# EAGLE schematic BMSTEST-v1.0 (EAGLE 7.7.0)

## Sheet 1 of 4
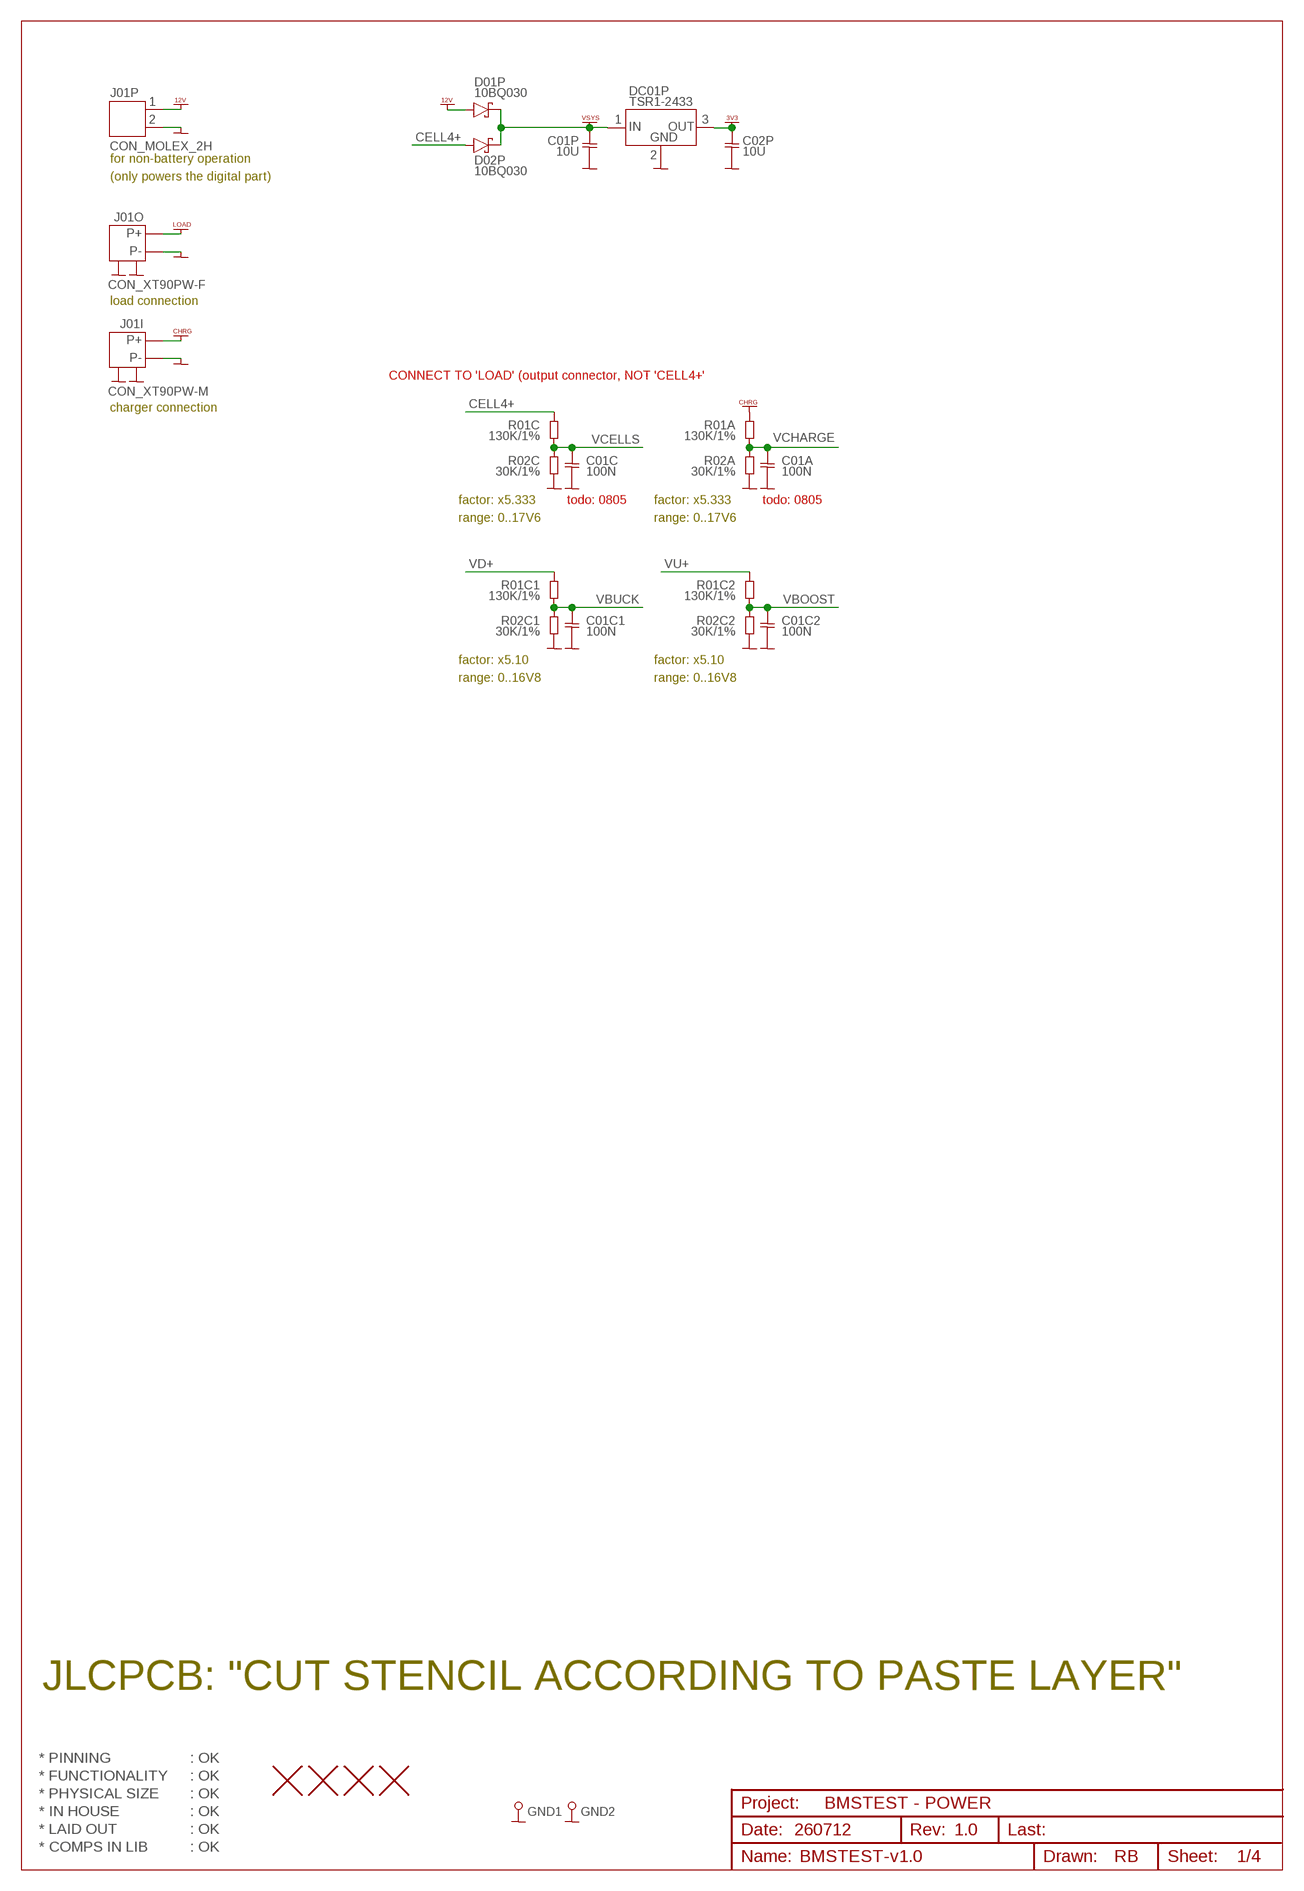
[diagram p0: schematic, sheet 1]

### Parts
C01A  100N  CAP0603  [CAP0603]
C01C  100N  CAP0603  [CAP0603]
C01C1  100N  CAP0603  [CAP0603]
C01C2  100N  CAP0603  [CAP0603]
C01P  10U  CAP0805  [CAP0805]
C02P  10U  CAP0805  [CAP0805]
D01P  10BQ030  DIODE_10BQ030  [DIODE_SMB]
D02P  10BQ030  DIODE_10BQ030  [DIODE_SMB]
DC01P  TSR1-2433  [TSR1-2433]
GND1  PIN_TEST  [HOLE_PTH_0.8MM]
GND2  PIN_TEST  [HOLE_PTH_0.8MM]
H1  HOLE_NPTH_3.2MM  [HOLE_NPTH_3.2MM]
H2  HOLE_NPTH_3.2MM  [HOLE_NPTH_3.2MM]
H3  HOLE_NPTH_3.2MM  [HOLE_NPTH_3.2MM]
H4  HOLE_NPTH_3.2MM  [HOLE_NPTH_3.2MM]
J01I  CON_XT90PW-M  [CON_XT90PW-M]
J01O  CON_XT90PW-F  [CON_XT90PW-F]
J01P  CON_MOLEX_2H  [CON_MOLEX_2H]
R01A  130K/1%  RES0603  [RES0603]
R01C  130K/1%  RES0603  [RES0603]
R01C1  130K/1%  RES0603  [RES0603]
R01C2  130K/1%  RES0603  [RES0603]
R02A  30K/1%  RES0603  [RES0603]
R02C  30K/1%  RES0603  [RES0603]
R02C1  30K/1%  RES0603  [RES0603]
R02C2  30K/1%  RES0603  [RES0603]

### Nets
CELL4+ [dikke power]: D02P.A(+) R01C.2 ; also sheet 4
GND: C01A.2 C01C1.2 C01C2.2 C01C.2 C01P.2 C02P.2 DC01P.2(2.GND) GND1.1 GND2.1 J01I.- J01I.CASE1 J01I.CASE2 J01O.- J01O.CASE1 J01O.CASE2 J01P.2 R02A.1 R02C1.1 R02C2.1 R02C.1 ; also sheet 2,3,4
V_CHARGER: J01I.+ R01A.2 ; also sheet 4
V_LOAD: J01O.+ ; also sheet 4
VBOOST: C01C2.1 R01C2.1 R02C2.2 ; also sheet 2
VBUCK: C01C1.1 R01C1.1 R02C1.2 ; also sheet 2
VCELLS: C01C.1 R01C.1 R02C.2 ; also sheet 2
VCHARGE: C01A.1 R01A.1 R02A.2 ; also sheet 2
VD+: R01C1.2 ; also sheet 3
VDD_3V3: C02P.1 DC01P.3(3.OUT) ; supply symbol labelled VCC_3V3 ; also sheet 2,3,4
VDD_12V: D01P.A(+) J01P.1 ; supply symbol labelled VCC_12V
VSYS: C01P.1 D01P.C(-) D02P.C(-) DC01P.1(1.IN) ; also sheet 3
VU+: R01C2.2 ; also sheet 3

### Notes on the sheet
- for non-battery operation
- (only powers the digital part)
- load connection
- CONNECT TO 'LOAD' (output connector, NOT 'CELL4+'
- charger connection
- factor: x5.333 | todo: 0805 | factor: x5.333 | todo: 0805
- range: 0..17V6 | range: 0..17V6
- factor: x5.10 | factor: x5.10
- range: 0..16V8 | range: 0..16V8
- JLCPCB: "CUT STENCIL ACCORDING TO PASTE LAYER"
- * PINNING | : OK
- * FUNCTIONALITY | : OK
- * PHYSICAL SIZE | : OK
- BMSTEST - POWER
- * IN HOUSE | : OK
- * LAID OUT | : OK | 260712 | 1.0
- * COMPS IN LIB | : OK

## Sheet 2 of 4
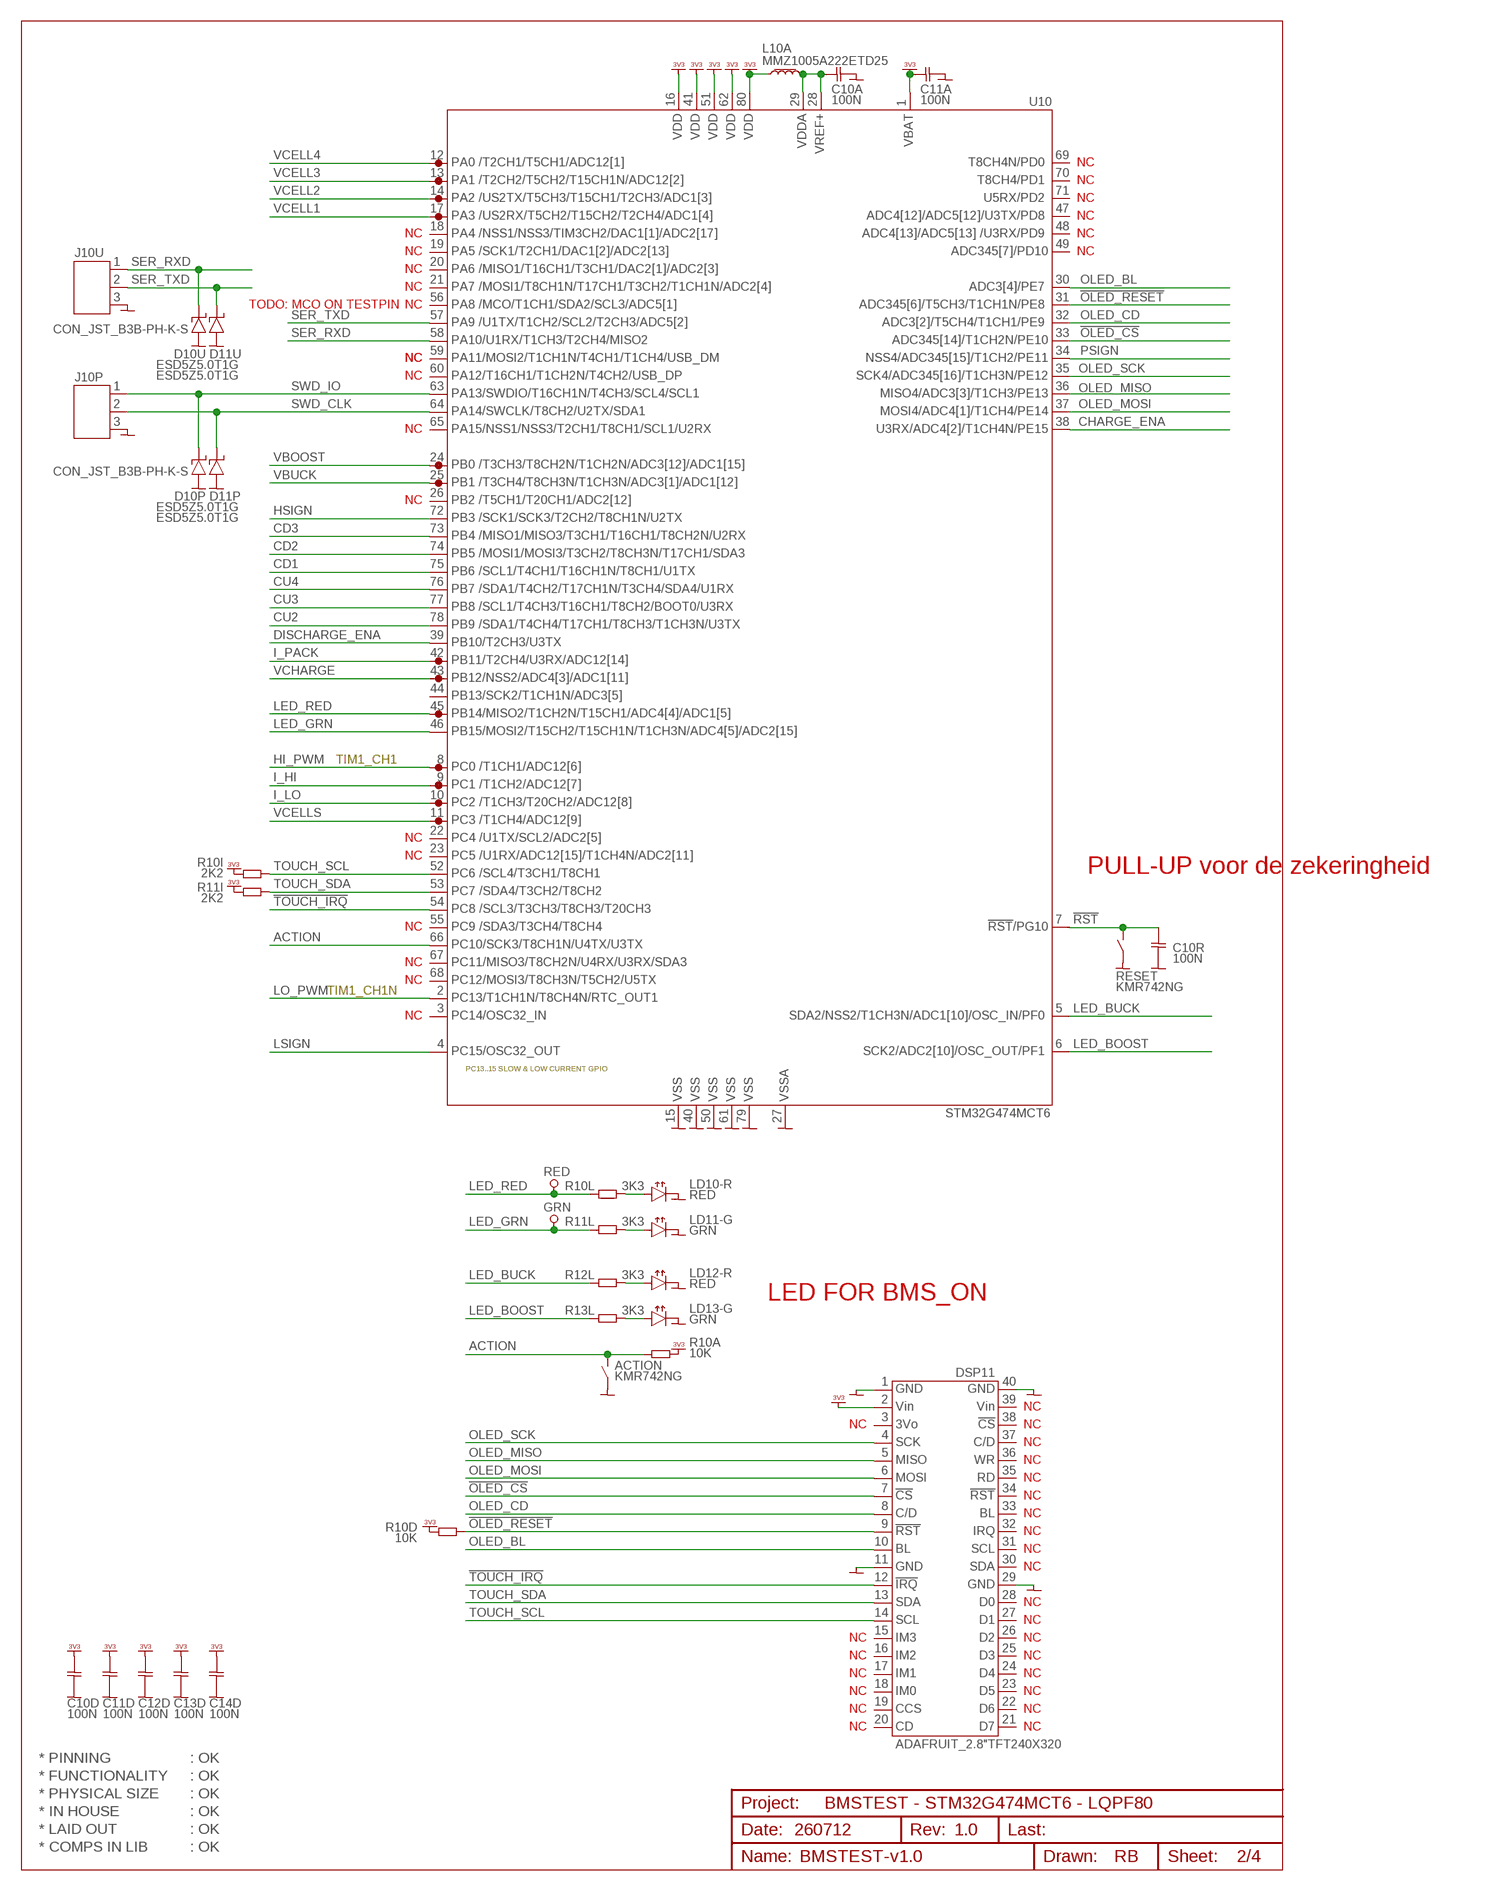
[diagram p1: schematic, sheet 2]

### Parts
ACTION  KMR742NG  SWITCH_PUSHBUTTON_KMR742NG  [SWITCH_PUSHBUTTON_KMR742NG]
C10A  100N  CAP0402  [CAP0402]
C10D  100N  CAP0402  [CAP0402]
C10R  100N  CAP0603  [CAP0603]
C11A  100N  CAP0402  [CAP0402]
C11D  100N  CAP0402  [CAP0402]
C12D  100N  CAP0402  [CAP0402]
C13D  100N  CAP0402  [CAP0402]
C14D  100N  CAP0402  [CAP0402]
D10P  ESD5Z5.0T1G  DIODE_TVS_SOD523  [DIODE_SOD523]
D10U  ESD5Z5.0T1G  DIODE_TVS_SOD523  [DIODE_SOD523]
D11P  ESD5Z5.0T1G  DIODE_TVS_SOD523  [DIODE_SOD523]
D11U  ESD5Z5.0T1G  DIODE_TVS_SOD523  [DIODE_SOD523]
DSP11  ADAFRUIT_2.8"TFT240X320  [ADAFRUIT_2.8"TFT240X320]
GRN  PIN_TEST  [HOLE_PTH_0.8MM]
J10P  CON_JST_B3B-PH-K-S  [CON_JST_B3B-PH-K-S]
J10U  CON_JST_B3B-PH-K-S  [CON_JST_B3B-PH-K-S]
L10A  MMZ1005A222ETD25  L_0402_LOSSY  [L_0402]
LD10-R  RED  LED_SMD_0603  [LED_SMD_0603]
LD11-G  GRN  LED_SMD_0603  [LED_SMD_0603]
LD12-R  RED  LED_SMD_0603  [LED_SMD_0603]
LD13-G  GRN  LED_SMD_0603  [LED_SMD_0603]
R10A  10K  RES0603  [RES0603]
R10D  10K  RES0603  [RES0603]
R10I  2K2  RES0402  [RES0402]
R10L  3K3  RES0603  [RES0603]
R11I  2K2  RES0402  [RES0402]
R11L  3K3  RES0603  [RES0603]
R12L  3K3  RES0603  [RES0603]
R13L  3K3  RES0603  [RES0603]
RED  PIN_TEST  [HOLE_PTH_0.8MM]
RESET  KMR742NG  SWITCH_PUSHBUTTON_KMR742NG  [SWITCH_PUSHBUTTON_KMR742NG]
U10  STM32G474MCT6  [LQFP80]

### Nets
!OLED_CS: DSP11.7(7.CS) U10.33(33.PE10)
!OLED_RESET: DSP11.9(9.!RST) R10D.2 U10.31(31.PE8)
!RST: C10R.1 RESET.1 RESET.4 U10.7(7.!RST)
!TOUCH_IRQ: DSP11.12(12.IRQ) U10.54(54.PC8)
ACTION: ACTION.1 ACTION.4 R10A.1 U10.66(66.PC10)
CD1: U10.75(75.PB6) ; also sheet 3
CD2: U10.74(74.PB5) ; also sheet 3
CD3: U10.73(73.PB4) ; also sheet 3
CHARGE_ENA: U10.38(38.PE15) ; also sheet 4
CU2: U10.78(78.PB9) ; also sheet 3
CU3: U10.77(77.PB8) ; also sheet 3
CU4: U10.76(76.PB7) ; also sheet 3
DISCHARGE_ENA: U10.39(39.PB10) ; also sheet 4
GND: ACTION.2 ACTION.3 C10A.2 C10D.2 C10R.2 C11A.2 C11D.2 C12D.2 C13D.2 C14D.2 D10P.A D10U.A D11P.A D11U.A DSP11.1(1.GND) DSP11.11(11.GND) DSP11.29(29.GND) DSP11.40(40.GND) J10P.3 J10U.3 LD10-R.C LD11-G.C LD12-R.C LD13-G.C RESET.2 RESET.3 U10.15(15.VSS) U10.27(27.VSSA) U10.40(40.VSS) U10.50(50.VSS) U10.61(61.VSS) U10.79(79.VSS) ; also sheet 1,3,4
HI_PWM: U10.8(8.PC0) ; also sheet 3
HSIGN: U10.72(72.PB3) ; also sheet 3
I_HI: U10.9(9.PC1) ; also sheet 3
I_LO: U10.10(10.PC2) ; also sheet 3
I_PACK: U10.42(42.PB11) ; also sheet 4
LED_BOOST: R13L.1 U10.6(6.OSC_OUT)
LED_BUCK: R12L.1 U10.5(5.OSC_IN)
LED_GRN: GRN.1 R11L.1 U10.46(46.PB15)
LED_RED: R10L.1 RED.1 U10.45(45.PB14)
LO_PWM: U10.2(2.PC13) ; also sheet 3
LSIGN: U10.4(4.PC15) ; also sheet 3
N$23: LD11-G.A R11L.2
N$35: LD12-R.A R12L.2
N$36: LD13-G.A R13L.2
N$39: LD10-R.A R10L.2
OLED_BL: DSP11.10(10.BL) U10.30(30.PE7)
OLED_CD: DSP11.8(8.D/C) U10.32(32.PE9)
OLED_MISO: DSP11.5(5.MISO) U10.36(36.PE13)
OLED_MOSI: DSP11.6(6.MOSI) U10.37(37.PE14)
OLED_SCK: DSP11.4(4.SCK) U10.35(35.PE12)
PSIGN: U10.34(34.PE11) ; also sheet 4
SER_RXD: D10U.C J10U.1 U10.58(58.PA10)
SER_TXD: D11U.C J10U.2 U10.57(57.PA9)
SWD_CLK: D11P.C J10P.2 U10.64(64.PA14)
SWD_IO: D10P.C J10P.1 U10.63(63.PA13)
TOUCH_SCL: DSP11.14(14.SCL) R10I.1 U10.52(52.PC6)
TOUCH_SDA: DSP11.13(13.SDA) R11I.1 U10.53(53.PC7)
VBOOST: U10.24(24.PB0) ; also sheet 1
VBUCK: U10.25(25.PB1) ; also sheet 1
VCELL1: U10.17(17.PA3) ; also sheet 4
VCELL2: U10.14(14.PA2) ; also sheet 4
VCELL3: U10.13(13.PA1) ; also sheet 4
VCELL4: U10.12(12.PA0) ; also sheet 4
VCELLS: U10.11(11.PC3) ; also sheet 1
VCHARGE: U10.43(43.PB12) ; also sheet 1
VDD_3V3: C10D.1 C11A.1 C11D.1 C12D.1 C13D.1 C14D.1 DSP11.2(2.VIN) L10A.1 R10A.2 R10D.1 R10I.2 R11I.2 U10.1(1.VBAT) U10.16(16.VDD) U10.41(41.VDD) U10.51(51.VDD) U10.62(62.VDD) U10.80(80.VDD) ; supply symbol labelled VCC_3V3 ; also sheet 1,3,4
VDDA1: C10A.1 L10A.2 U10.28(28.VREF+) U10.29(29.VDDA)
Unconnected: DSP11.3(3.3VO) DSP11.15(15.IM3) DSP11.16(16.IM2) DSP11.17(17.IM1) DSP11.18(18.IM0) DSP11.19(19.CCS) DSP11.20(20.CD) DSP11.21(21.D7) DSP11.22(22.D6) DSP11.23(23.D5) DSP11.24(24.D4) DSP11.25(25.D3) DSP11.26(26.D2) DSP11.27(27.D1) DSP11.28(28.D0) DSP11.30(30.SDA) DSP11.31(31.SCL) DSP11.32(32.IRQ) DSP11.33(33.BL) DSP11.34(34.!RST) DSP11.35(35.RD) DSP11.36(36.WR) DSP11.37(37.C/D) DSP11.38(38.CS) DSP11.39(39.VIN) U10.3(3.PC14) U10.18(18.PA4) U10.19(19.PA5) U10.20(20.PA6) U10.21(21.PA7) U10.22(22.PC4) U10.23(23.PC5) U10.26(26.PB2) U10.44(44.PB13) U10.47(47.PD8) U10.48(48.PD9) U10.49(49.PD10) U10.55(55.PC9) U10.56(56.PA8) U10.59(59.PA11) U10.60(60.PA12) U10.65(65.PA15) U10.67(67.PC11) U10.68(68.PC12) U10.69(69.PD0) U10.70(70.PD1) U10.71(71.PD2)

### Notes on the sheet
- NC
- NC
- NC
- NC
- NC | NC
- NC | NC
- NC
- NC
- TODO: MCO ON TESTPIN | NC
- NC | NC
- NC
- NC
- NC
- TIM1_CH1
- NC
- NC
- PULL-UP voor de zekeringheid
- NC
- NC
- NC
- TIM1_CH1N
- NC
- LED FOR BMS_ON
- NC
- NC | NC
- NC
- NC
- NC
- NC
- NC
- NC
- NC
- NC
- NC
- NC
- NC | NC
- NC | NC
- NC | NC
- NC | NC
- NC | NC
- NC | NC
- * PINNING | : OK
- * FUNCTIONALITY | : OK
- * PHYSICAL SIZE | : OK
- BMSTEST - STM32G474MCT6 - LQPF80
- * IN HOUSE | : OK
- * LAID OUT | : OK | 260712 | 1.0
- * COMPS IN LIB | : OK

## Sheet 3 of 4
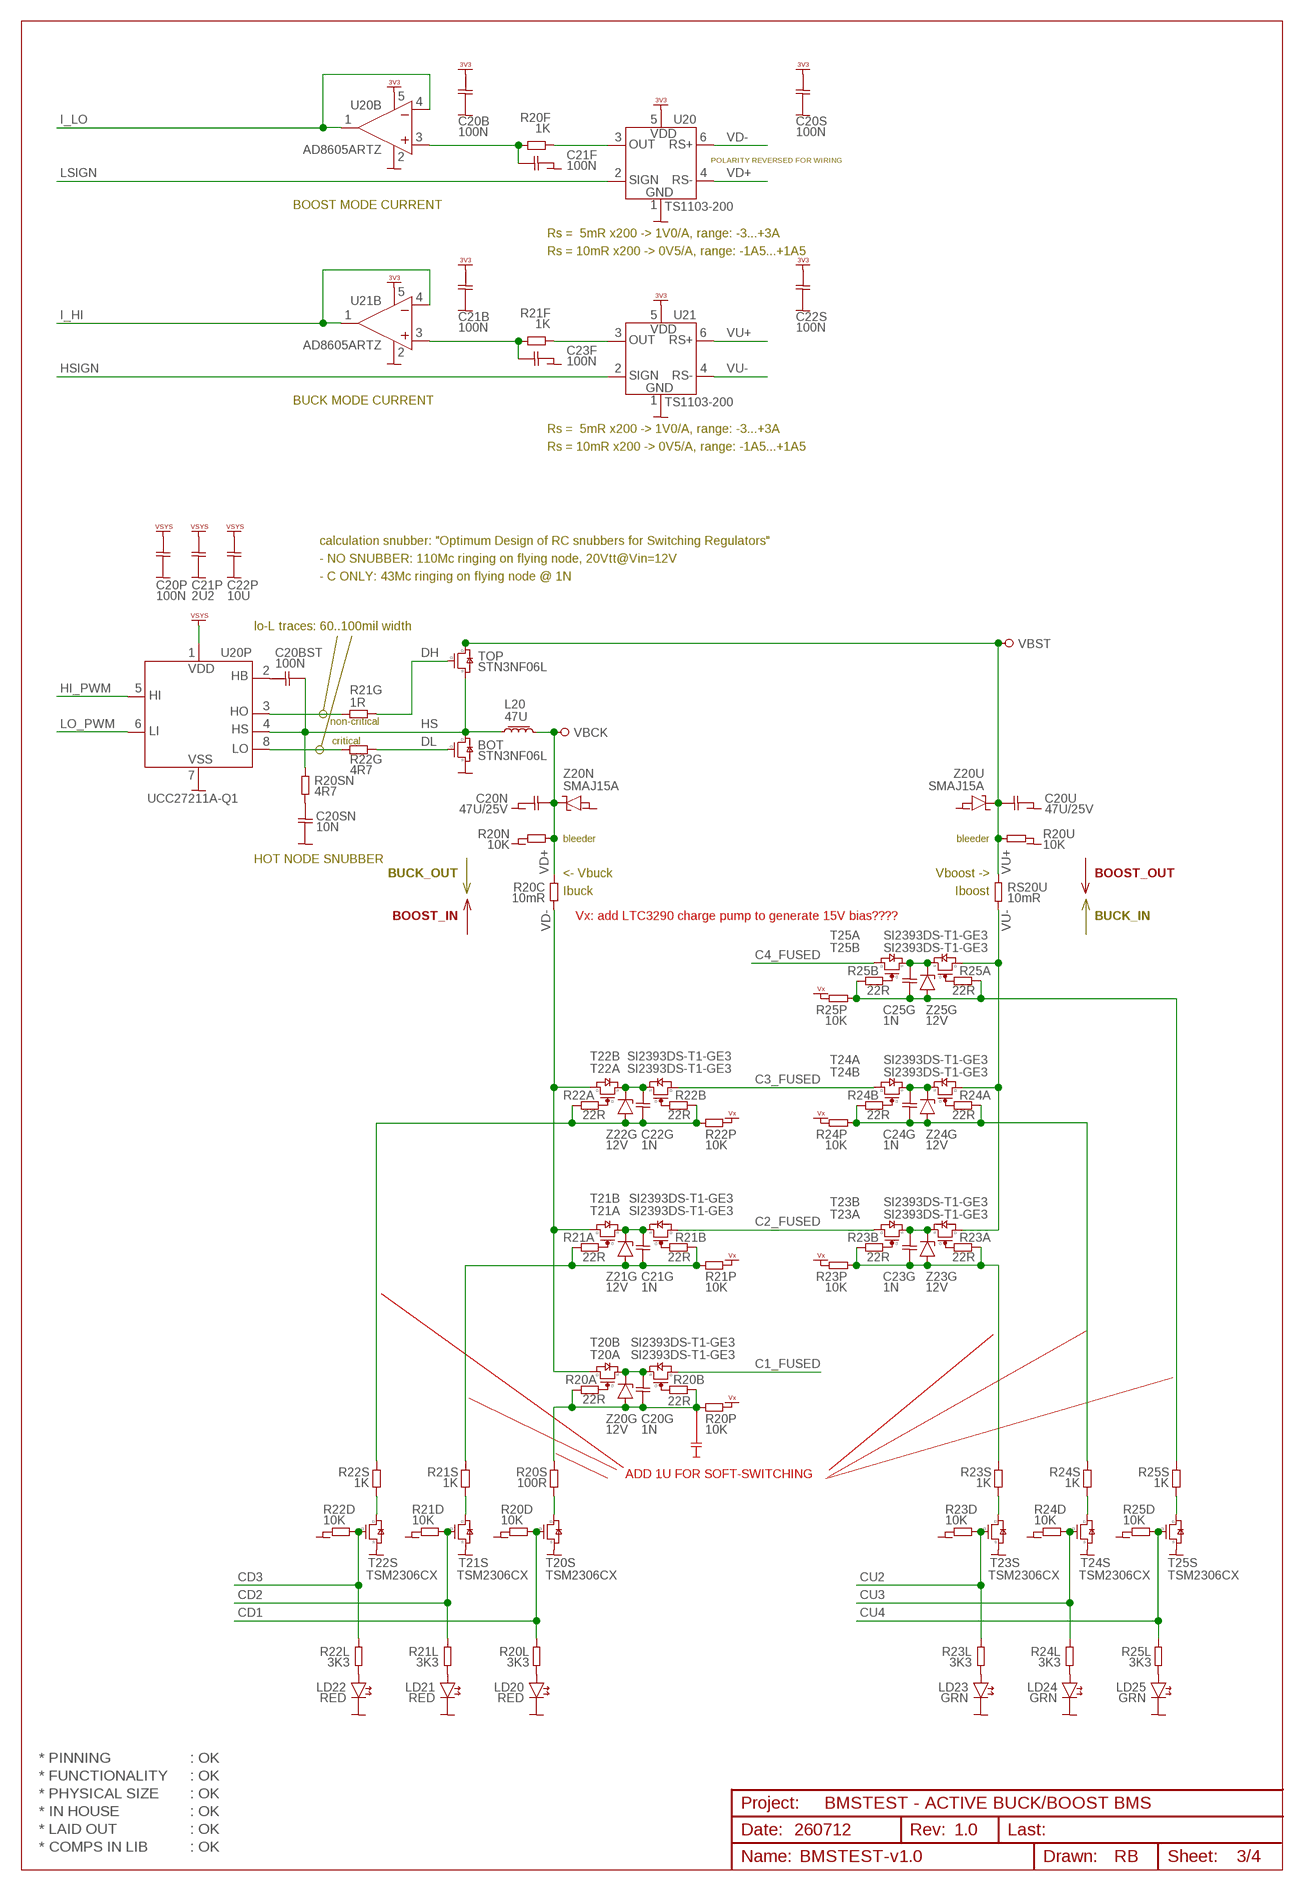
[diagram p2: schematic, sheet 3]

### Parts
BOT  STN3NF06L  NFET_SOT223_IRFL024ZPBF  [SOT223]
C20B  100N  CAP0603  [CAP0603]
C20BST  100N  CAP0805  [CAP0805]
C20G  1N  CAP0603  [CAP0603]
C20N  47U/25V  CAP1210  [CAP1210]
C20P  100N  CAP0603  [CAP0603]
C20S  100N  CAP0603  [CAP0603]
C20SN  10N  CAP0805  [CAP0805]
C20U  47U/25V  CAP1210  [CAP1210]
C21B  100N  CAP0603  [CAP0603]
C21F  100N  CAP0603  [CAP0603]
C21G  1N  CAP0603  [CAP0603]
C21P  2U2  CAP0603  [CAP0603]
C22G  1N  CAP0603  [CAP0603]
C22P  10U  CAP0805  [CAP0805]
C22S  100N  CAP0603  [CAP0603]
C23F  100N  CAP0603  [CAP0603]
C23G  1N  CAP0603  [CAP0603]
C24G  1N  CAP0603  [CAP0603]
C25G  1N  CAP0603  [CAP0603]
L20  47U  L_WE_HCI_6.9X6.9  [L_WE_HCI_6.9X6.9]
LD20  RED  LED_SMD_0603  [LED_SMD_0603]
LD21  RED  LED_SMD_0603  [LED_SMD_0603]
LD22  RED  LED_SMD_0603  [LED_SMD_0603]
LD23  GRN  LED_SMD_0603  [LED_SMD_0603]
LD24  GRN  LED_SMD_0603  [LED_SMD_0603]
LD25  GRN  LED_SMD_0603  [LED_SMD_0603]
R20A  22R  RES0603  [RES0603]
R20B  22R  RES0603  [RES0603]
R20C  10mR  RES1206  [RES1206]
R20D  10K  RES0603  [RES0603]
R20F  1K  RES0603  [RES0603]
R20L  3K3  RES0603  [RES0603]
R20N  10K  RES0805  [RES0805]
R20P  10K  RES0603  [RES0603]
R20S  100R  RES0603  [RES0603]
R20SN  4R7  RES0805  [RES0805]
R20U  10K  RES0805  [RES0805]
R21A  22R  RES0603  [RES0603]
R21B  22R  RES0603  [RES0603]
R21D  10K  RES0603  [RES0603]
R21F  1K  RES0603  [RES0603]
R21G  1R  RES0508  [RES0508]
R21L  3K3  RES0603  [RES0603]
R21P  10K  RES0603  [RES0603]
R21S  1K  RES0603  [RES0603]
R22A  22R  RES0603  [RES0603]
R22B  22R  RES0603  [RES0603]
R22D  10K  RES0603  [RES0603]
R22G  4R7  RES0508  [RES0508]
R22L  3K3  RES0603  [RES0603]
R22P  10K  RES0603  [RES0603]
R22S  1K  RES0603  [RES0603]
R23A  22R  RES0603  [RES0603]
R23B  22R  RES0603  [RES0603]
R23D  10K  RES0603  [RES0603]
R23L  3K3  RES0603  [RES0603]
R23P  10K  RES0603  [RES0603]
R23S  1K  RES0603  [RES0603]
R24A  22R  RES0603  [RES0603]
R24B  22R  RES0603  [RES0603]
R24D  10K  RES0603  [RES0603]
R24L  3K3  RES0603  [RES0603]
R24P  10K  RES0603  [RES0603]
R24S  1K  RES0603  [RES0603]
R25A  22R  RES0603  [RES0603]
R25B  22R  RES0603  [RES0603]
R25D  10K  RES0603  [RES0603]
R25L  3K3  RES0603  [RES0603]
R25P  10K  RES0603  [RES0603]
R25S  1K  RES0603  [RES0603]
RS20U  10mR  RES1206  [RES1206]
T20A  SI2393DS-T1-GE3  PFET_SOT23  [PFET_SOT23]
T20B  SI2393DS-T1-GE3  PFET_SOT23  [PFET_SOT23]
T20S  TSM2306CX  NFET_SOT23  [NFET_SOT23]
T21A  SI2393DS-T1-GE3  PFET_SOT23  [PFET_SOT23]
T21B  SI2393DS-T1-GE3  PFET_SOT23  [PFET_SOT23]
T21S  TSM2306CX  NFET_SOT23  [NFET_SOT23]
T22A  SI2393DS-T1-GE3  PFET_SOT23  [PFET_SOT23]
T22B  SI2393DS-T1-GE3  PFET_SOT23  [PFET_SOT23]
T22S  TSM2306CX  NFET_SOT23  [NFET_SOT23]
T23A  SI2393DS-T1-GE3  PFET_SOT23  [PFET_SOT23]
T23B  SI2393DS-T1-GE3  PFET_SOT23  [PFET_SOT23]
T23S  TSM2306CX  NFET_SOT23  [NFET_SOT23]
T24A  SI2393DS-T1-GE3  PFET_SOT23  [PFET_SOT23]
T24B  SI2393DS-T1-GE3  PFET_SOT23  [PFET_SOT23]
T24S  TSM2306CX  NFET_SOT23  [NFET_SOT23]
T25A  SI2393DS-T1-GE3  PFET_SOT23  [PFET_SOT23]
T25B  SI2393DS-T1-GE3  PFET_SOT23  [PFET_SOT23]
T25S  TSM2306CX  NFET_SOT23  [NFET_SOT23]
TOP  STN3NF06L  NFET_SOT223_IRFL024ZPBF  [SOT223]
U20  TS1103-200  [SOT23-6]
U20B  AD8605ARTZ  [SOT23-5]
U20P  UCC27211A-Q1  [SO8-EP]
U21  TS1103-200  [SOT23-6]
U21B  AD8605ARTZ  [SOT23-5]
VBCK  PIN_TEST  [HOLE_PTH_0.8MM]
VBST  PIN_TEST  [HOLE_PTH_0.8MM]
Z20G  12V  ZENER_SOD80  [ZENER_SOD80]
Z20N  SMAJ15A  DIODE_SMA  [DIODE_SMA_UNI]
Z20U  SMAJ15A  DIODE_SMA  [DIODE_SMA_UNI]
Z21G  12V  ZENER_SOD80  [ZENER_SOD80]
Z22G  12V  ZENER_SOD80  [ZENER_SOD80]
Z23G  12V  ZENER_SOD80  [ZENER_SOD80]
Z24G  12V  ZENER_SOD80  [ZENER_SOD80]
Z25G  12V  ZENER_SOD80  [ZENER_SOD80]

### Nets
C1_FUSED: T20B.3(D) ; also sheet 4
C2_FUSED: T21B.3(D) T23B.3(D) ; also sheet 4
C3_FUSED: T22B.3(D) T24B.3(D) ; also sheet 4
C4_FUSED: T25B.3(D) ; also sheet 4
CD1: R20D.2 R20L.2 T20S.G(G1) ; also sheet 2
CD2: R21D.2 R21L.2 T21S.G(G1) ; also sheet 2
CD3: R22D.2 R22L.2 T22S.G(G1) ; also sheet 2
CU2: R23D.2 R23L.2 T23S.G(G1) ; also sheet 2
CU3: R24D.2 R24L.2 T24S.G(G1) ; also sheet 2
CU4: R25D.2 R25L.2 T25S.G(G1) ; also sheet 2
DH: R21G.2 TOP.1(G)
DL: BOT.1(G) R22G.2
G0: C20G.2 R20A.2 R20B.1 R20P.2 R20S.1 Z20G.1(A)
G1: C21G.2 R21A.2 R21B.1 R21P.2 R21S.1 Z21G.1(A)
G2: C22G.2 R22A.2 R22B.1 R22P.2 R22S.1 Z22G.1(A)
G3: C23G.2 R23A.1 R23B.2 R23P.2 R23S.1 Z23G.1(A)
G4: C24G.2 R24A.1 R24B.2 R24P.2 R24S.1 Z24G.1(A)
G5: C25G.2 R25A.1 R25B.2 R25P.2 R25S.1 Z25G.1(A)
GND: BOT.3(S) C20B.2 C20N.1 C20P.2 C20S.2 C20SN.2 C20U.2 C21B.2 C21F.1 C21P.2 C22P.2 C22S.2 C23F.1 LD20.C LD21.C LD22.C LD23.C LD24.C LD25.C R20D.1 R20N.2 R20U.2 R21D.1 R22D.1 R23D.1 R24D.1 R25D.1 T20S.S(S2) T21S.S(S2) T22S.S(S2) T23S.S(S2) T24S.S(S2) T25S.S(S2) U20.1(1.GND) U20B.2(2.V-) U20P.7(7.VSS) U20P.EP(7.VSS) U21.1(1.GND) U21B.2(2.V-) Z20N.2(A) Z20U.2(A) ; also sheet 1,2,4
HB: C20BST.1 U20P.2(2.HB)
HI_PWM: U20P.5(5.HI) ; also sheet 2
HO: R21G.1 U20P.3(3.HO)
HS: BOT.2(D) BOT.4(D1) C20BST.2 L20.1 R20SN.1 TOP.3(S) U20P.4(4.HS)
HSIGN: U21.2(2.SIGN) ; also sheet 2
I_HI: U21B.1(1.OUT) U21B.4(4.IN-) ; also sheet 2
I_HI*: C23F.2 R21F.2 U21B.3(3.IN+)
I_LO: U20B.1(1.OUT) U20B.4(4.IN-) ; also sheet 2
I_LO*: C21F.2 R20F.2 U20B.3(3.IN+)
LO: R22G.1 U20P.8(8.LO)
LO_PWM: U20P.6(6.LI) ; also sheet 2
LSIGN: U20.2(2.SIGN) ; also sheet 2
N$1: LD22.A R22L.1
N$2: LD21.A R21L.1
N$3: R23B.1 T23B.1(G)
N$4: LD20.A R20L.1
N$5: R24B.1 T24B.1(G)
N$9: R21A.1 T21A.1(G)
N$10: R21B.2 T21B.1(G)
N$11: R20A.1 T20A.1(G)
N$13: R22B.2 T22B.1(G)
N$14: R20B.2 T20B.1(G)
N$15: R22A.1 T22A.1(G)
N$16: R23A.2 T23A.1(G)
N$17: R25B.1 T25B.1(G)
N$18: R24A.2 T24A.1(G)
N$20: R22S.2 T22S.D(D3)
N$21: R21S.2 T21S.D(D3)
N$22: R20S.2 T20S.D(D3)
N$24: R25A.2 T25A.1(G)
N$25: R23S.2 T23S.D(D3)
N$28: R24S.2 T24S.D(D3)
N$29: C20SN.1 R20SN.2
N$30: R25S.2 T25S.D(D3)
N$31: LD23.A R23L.1
N$32: LD24.A R24L.1
N$33: LD25.A R25L.1
N$34: R20F.1 U20.3(3.OUT)
N$40: R21F.1 U21.3(3.OUT)
S0: C20G.1 T20A.2(S) T20B.2(S) Z20G.2(C)
S1: C21G.1 T21A.2(S) T21B.2(S) Z21G.2(C)
S2: C22G.1 T22A.2(S) T22B.2(S) Z22G.2(C)
S3: C23G.1 T23A.2(S) T23B.2(S) Z23G.2(C)
S4: C24G.1 T24A.2(S) T24B.2(S) Z24G.2(C)
S5: C25G.1 T25A.2(S) T25B.2(S) Z25G.2(C)
VD+: C20N.2 L20.2 R20C.1 R20N.1 U20.4(4.RS-) VBCK.1 Z20N.1(C) ; also sheet 1
VD-: R20C.2 T20A.3(D) T21A.3(D) T22A.3(D) U20.6(6.RS+)
VDD_3V3: C20B.1 C20S.1 C21B.1 C22S.1 U20.5(5.VDD) U20B.5(5.V+) U21.5(5.VDD) U21B.5(5.V+) ; supply symbol labelled VCC_3V3 ; also sheet 1,2,4
VSYS: C20P.1 C21P.1 C22P.1 U20P.1(1.VDD) ; also sheet 1
VU+: C20U.1 R20U.1 RS20U.1 TOP.2(D) TOP.4(D1) U21.6(6.RS+) VBST.1 Z20U.1(C) ; also sheet 1
VU-: RS20U.2 T23A.3(D) T24A.3(D) T25A.3(D) U21.4(4.RS-)
VX: R20P.1 R21P.1 R22P.1 R23P.1 R24P.1 R25P.1 ; also sheet 4

### Notes on the sheet
- POLARITY REVERSED FOR WIRING
- BOOST MODE CURRENT
- Rs =  5mR x200 -> 1V0/A, range: -3...+3A
- Rs = 10mR x200 -> 0V5/A, range: -1A5...+1A5
- BUCK MODE CURRENT
- Rs =  5mR x200 -> 1V0/A, range: -3...+3A
- Rs = 10mR x200 -> 0V5/A, range: -1A5...+1A5
- calculation snubber: "Optimum Design of RC snubbers for Switching Regulators"
- - NO SNUBBER: 110Mc ringing on flying node, 20Vtt@Vin=12V
- - C ONLY: 43Mc ringing on flying node @ 1N
- lo-L traces: 60..100mil width
- non-critical
- critical
- bleeder | bleeder
- HOT NODE SNUBBER
- BUCK_OUT | <- Vbuck | Vboost -> | BOOST_OUT
- Ibuck | Iboost
- BOOST_IN | Vx: add LTC3290 charge pump to generate 15V bias???? | BUCK_IN
- ADD 1U FOR SOFT-SWITCHING
- * PINNING | : OK
- * FUNCTIONALITY | : OK
- * PHYSICAL SIZE | : OK
- BMSTEST - ACTIVE BUCK/BOOST BMS
- * IN HOUSE | : OK
- * LAID OUT | : OK | 260712 | 1.0
- * COMPS IN LIB | : OK

## Sheet 4 of 4
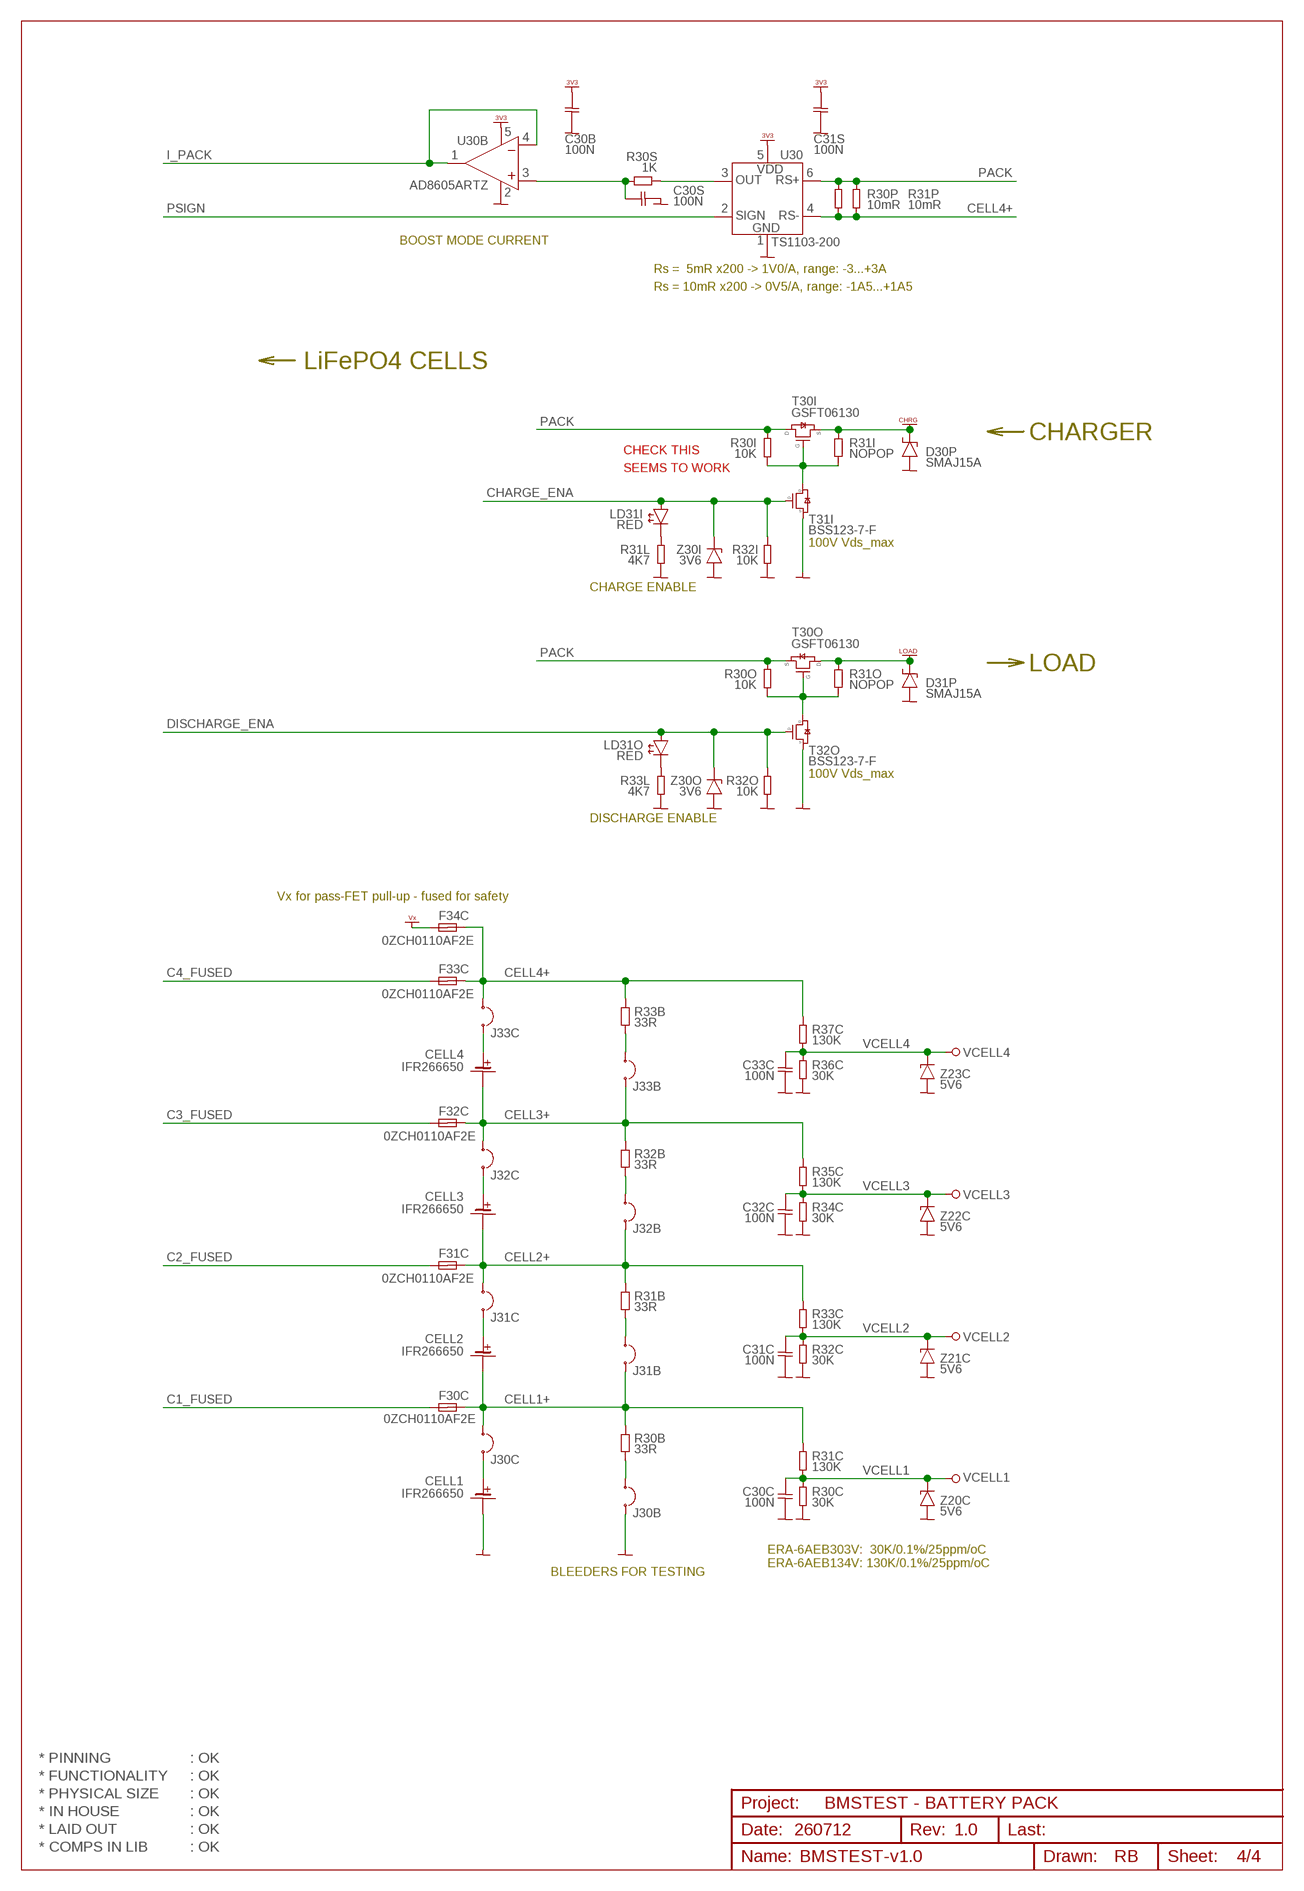
[diagram p3: schematic, sheet 4]

### Parts
C30B  100N  CAP0603  [CAP0603]
C30C  100N  CAP0805  [CAP0805]
C30S  100N  CAP0603  [CAP0603]
C31C  100N  CAP0805  [CAP0805]
C31S  100N  CAP0603  [CAP0603]
C32C  100N  CAP0805  [CAP0805]
C33C  100N  CAP0805  [CAP0805]
CELL1  IFR266650  BATTERY_HOLDER_26650  [BATTERY_HOLDER_26650]
CELL2  IFR266650  BATTERY_HOLDER_26650  [BATTERY_HOLDER_26650]
CELL3  IFR266650  BATTERY_HOLDER_26650  [BATTERY_HOLDER_26650]
CELL4  IFR266650  BATTERY_HOLDER_26650  [BATTERY_HOLDER_26650]
D30P  SMAJ15A  DIODE_SMA  [DIODE_SMA_UNI]
D31P  SMAJ15A  DIODE_SMA  [DIODE_SMA_UNI]
F30C  0ZCH0110AF2E  POLYFUSE1210  [POLYFUSE1210]
F31C  0ZCH0110AF2E  POLYFUSE1210  [POLYFUSE1210]
F32C  0ZCH0110AF2E  POLYFUSE1210  [POLYFUSE1210]
F33C  0ZCH0110AF2E  POLYFUSE1210  [POLYFUSE1210]
F34C  0ZCH0110AF2E  POLYFUSE1210  [POLYFUSE1210]
J30B  GOLD2  [GOLD2]
J30C  GOLD2  [GOLD2]
J31B  GOLD2  [GOLD2]
J31C  GOLD2  [GOLD2]
J32B  GOLD2  [GOLD2]
J32C  GOLD2  [GOLD2]
J33B  GOLD2  [GOLD2]
J33C  GOLD2  [GOLD2]
LD31I  RED  LED_SMD_0603  [LED_SMD_0603]
LD31O  RED  LED_SMD_0603  [LED_SMD_0603]
R30B  33R  RES1210  [RES1210]
R30C  30K  RES0805  [RES0805]
R30I  10K  RES0603  [RES0603]
R30O  10K  RES0603  [RES0603]
R30P  10mR  RES1206  [RES1206]
R30S  1K  RES0603  [RES0603]
R31B  33R  RES1210  [RES1210]
R31C  130K  RES0805  [RES0805]
R31I  NOPOP  RES0603  [RES0603]
R31L  4K7  RES0603  [RES0603]
R31O  NOPOP  RES0603  [RES0603]
R31P  10mR  RES1206  [RES1206]
R32B  33R  RES1210  [RES1210]
R32C  30K  RES0805  [RES0805]
R32I  10K  RES0603  [RES0603]
R32O  10K  RES0603  [RES0603]
R33B  33R  RES1210  [RES1210]
R33C  130K  RES0805  [RES0805]
R33L  4K7  RES0603  [RES0603]
R34C  30K  RES0805  [RES0805]
R35C  130K  RES0805  [RES0805]
R36C  30K  RES0805  [RES0805]
R37C  130K  RES0805  [RES0805]
T30I  GSFT06130  PFET_GSFT06130  [D2PAK]
T30O  GSFT06130  PFET_GSFT06130  [D2PAK]
T31I  BSS123-7-F  NFET_SOT23  [NFET_SOT23]
T32O  BSS123-7-F  NFET_SOT23  [NFET_SOT23]
U30  TS1103-200  [SOT23-6]
U30B  AD8605ARTZ  [SOT23-5]
VCELL1  PIN_TEST  [HOLE_PTH_0.8MM]
VCELL2  PIN_TEST  [HOLE_PTH_0.8MM]
VCELL3  PIN_TEST  [HOLE_PTH_0.8MM]
VCELL4  PIN_TEST  [HOLE_PTH_0.8MM]
Z20C  5V6  ZENER_SOD80  [ZENER_SOD80]
Z21C  5V6  ZENER_SOD80  [ZENER_SOD80]
Z22C  5V6  ZENER_SOD80  [ZENER_SOD80]
Z23C  5V6  ZENER_SOD80  [ZENER_SOD80]
Z30I  3V6  ZENER_SOD80  [ZENER_SOD80]
Z30O  3V6  ZENER_SOD80  [ZENER_SOD80]

### Nets
!IN_ON: R30I.2 R31I.2 T30I.1(G) T31I.D(D3)
!OUT_ON: R30O.2 R31O.2 T30O.1(G) T32O.D(D3)
C1+ [dikke power]: CELL1.+ J30C.1
C1_FUSED: F30C.2 ; also sheet 3
C2+ [dikke power]: CELL2.+ J31C.1
C2_FUSED: F31C.2 ; also sheet 3
C3+ [dikke power]: CELL3.+ J32C.1
C3_FUSED: F32C.2 ; also sheet 3
C4+ [dikke power]: CELL4.+ J33C.1
C4_FUSED: F33C.2 ; also sheet 3
CELL1+ [dikke power]: CELL2.- F30C.1 J30C.2 J31B.1 R30B.2 R31C.1
CELL2+ [dikke power]: CELL3.- F31C.1 J31C.2 J32B.1 R31B.2 R33C.1
CELL3+ [dikke power]: CELL4.- F32C.1 J32C.2 J33B.1 R32B.2 R35C.1
CELL4+ [dikke power]: F33C.1 F34C.1 J33C.2 R30P.2 R31P.2 R33B.2 R37C.1 U30.4(4.RS-) ; also sheet 1
CHARGE_ENA: LD31I.A R32I.1 T31I.G(G1) Z30I.2(C) ; also sheet 2
DISCHARGE_ENA: LD31O.A R32O.1 T32O.G(G1) Z30O.2(C) ; also sheet 2
GND: C30B.2 C30C.2 C30S.1 C31C.2 C31S.2 C32C.2 C33C.2 CELL1.- D30P.2(A) D31P.2(A) J30B.1 R30C.2 R31L.2 R32C.2 R32I.2 R32O.2 R33L.2 R34C.2 R36C.2 T31I.S(S2) T32O.S(S2) U30.1(1.GND) U30B.2(2.V-) Z20C.1(A) Z21C.1(A) Z22C.1(A) Z23C.1(A) Z30I.1(A) Z30O.1(A) ; also sheet 1,2,3
I_LO*1: C30S.2 R30S.2 U30B.3(3.IN+)
I_PACK: U30B.1(1.OUT) U30B.4(4.IN-) ; also sheet 2
N$7: R30S.1 U30.3(3.OUT)
N$12: LD31I.C R31L.1
N$38: LD31O.C R33L.1
N$42: J30B.2 R30B.1
N$43: J31B.2 R31B.1
N$45: J32B.2 R32B.1
N$47: J33B.2 R33B.1
PACK: R30I.1 R30O.1 R30P.1 R31P.1 T30I.3(D) T30O.2(S) U30.6(6.RS+)
PSIGN: U30.2(2.SIGN) ; also sheet 2
V_CHARGER: D30P.1(C) R31I.1 T30I.2(S) ; also sheet 1
V_LOAD: D31P.1(C) R31O.1 T30O.3(D) ; also sheet 1
VCELL1: C30C.1 R30C.1 R31C.2 VCELL1.1 Z20C.2(C) ; also sheet 2
VCELL2: C31C.1 R32C.1 R33C.2 VCELL2.1 Z21C.2(C) ; also sheet 2
VCELL3: C32C.1 R34C.1 R35C.2 VCELL3.1 Z22C.2(C) ; also sheet 2
VCELL4: C33C.1 R36C.1 R37C.2 VCELL4.1 Z23C.2(C) ; also sheet 2
VDD_3V3: C30B.1 C31S.1 U30.5(5.VDD) U30B.5(5.V+) ; supply symbol labelled VCC_3V3 ; also sheet 1,2,3
VX: F34C.2 ; also sheet 3

### Notes on the sheet
- BOOST MODE CURRENT
- Rs =  5mR x200 -> 1V0/A, range: -3...+3A
- Rs = 10mR x200 -> 0V5/A, range: -1A5...+1A5
- LiFePO4 CELLS
- CHARGER
- CHECK THIS
- SEEMS TO WORK
- 100V Vds_max
- CHARGE ENABLE
- LOAD
- 100V Vds_max
- DISCHARGE ENABLE
- Vx for pass-FET pull-up - fused for safety
- ERA-6AEB303V:  30K/0.1%/25ppm/oC
  ERA-6AEB134V: 130K/0.1%/25ppm/oC
- BLEEDERS FOR TESTING
- * PINNING | : OK
- * FUNCTIONALITY | : OK
- * PHYSICAL SIZE | : OK
- BMSTEST - BATTERY PACK
- * IN HOUSE | : OK
- * LAID OUT | : OK | 260712 | 1.0
- * COMPS IN LIB | : OK

## Library data of the parts
ACTION RESET = 00-own_parts:SWITCH_PUSHBUTTON_KMR742NG: Switch, push button, SPNO, KMR742NG LFS, 'RESET' switch
BOT TOP = 00-own_parts:NFET_SOT223_IRFL024ZPBF: n-FET, IRFL024, SOT223
C01A C01C C01C1 C01C2 C10R C20B C20G C20P C20S C21B C21F C21G C21P C22G C22S C23F C23G C24G C25G C30B C30S C31S = 00-own_parts:CAP0603: Capacitor, ceramic, 0603
C01P C02P C20BST C20SN C22P C30C C31C C32C C33C = 00-own_parts:CAP0805: Capacitor, ceramic, 0805
C10A C10D C11A C11D C12D C13D C14D = 00-own_parts:CAP0402: Capacitor, ceramic, 0402
C20N C20U = 00-own_parts:CAP1210: Capacitor, ceramic, 1210
CELL1-CELL4 = 00-own_parts:BATTERY_HOLDER_26650: Battery holder, for 26650 cell, thru hole, manual prototype style
D01P D02P = 00-own_parts:DIODE_10BQ030: Diode, Schottky, 10BQ030, 30V/1A, SMB
D10P D10U D11P D11U = 00-own_parts:DIODE_TVS_SOD523: Diode, transient surpressor, SOD523
D30P D31P Z20N Z20U = 00-own_parts:DIODE_SMA: Diode, transient voltage suppressor, generic, uni-directional, SMA
DC01P = 00-own_parts:TSR1-2433: DC/DC converter, 1A, Vin: 4V75..36V, Vout: 3V3, thru hole, F# 169-6319
DSP11 = 00-own_parts:ADAFRUIT_2.8"TFT240X320: Display, TFT, 2.8", RGB240x320, capacitive touch, Vsupply: 3V3..5V, SPI, ILI9341
F30C F31C F32C F33C F34C = 00-own_parts:POLYFUSE1210: Polyfuse, 1210
GND1 GND2 GRN RED VBCK VBST VCELL1-VCELL4 = 00-own_parts:PIN_TEST: Pin, test pad, hole 0.8mm, pad 1.6mm
H1-H4 = 00-own_parts:HOLE_NPTH_3.2MM: Hole, NPTH, 3.2mm
J01I = 00-own_parts:CON_XT90PW-M: Connector, XT90PW, male, PCB, angle, 60A
J01O = 00-own_parts:CON_XT90PW-F: Connector, XT90PW, female, PCB, angle, 60A
J01P = 00-own_parts:CON_MOLEX_2H: Connector, Molex, header, right angle, 0.1", 2p, F#973-1148
J10P J10U = 00-own_parts:CON_JST_B3B-PH-K-S: Connector, JST, 2.0mm pitch, 3p, top entry
J30B J30C J31B J31C J32B J32C J33B J33C = 00-own_parts:GOLD2: Header, gold fingers, 0.1", 2x1
L10A = 00-own_parts:L_0402_LOSSY: Inductor, chip ferrite bead, lossy, 0402
L20 = 00-own_parts:L_WE_HCI_6.9X6.9: Inductor, Weurth, case WE-HCI, 6.9x6.9mm
LD10-R LD11-G LD12-R LD13-G LD20-LD25 LD31I LD31O = 00-own_parts:LED_SMD_0603: LED, SMD, 0603
R01A R01C R01C1 R01C2 R02A R02C R02C1 R02C2 R10A R10D R10I R10L R11I R11L R12L R13L R20A R20B R20C R20D R20F R20L R20N R20P R20S R20SN R20U R21A R21B R21D R21F R21G R21L R21P R21S R22A R22B R22D R22G R22L R22P R22S R23A R23B R23D R23L R23P R23S R24A R24B R24D R24L R24P R24S R25A R25B R25D R25L R25P R25S R30B R30C R30I R30O R30P R30S R31B R31C R31I R31L R31O R31P R32B R32C R32I R32O R33B R33C R33L R34C R35C R36C R37C RS20U = 00-own_parts:RES: Resistor, all shapes
T20A T20B T21A T21B T22A T22B T23A T23B T24A T24B T25A T25B = 00-own_parts:PFET_SOT23: p-FET, generic, SOT23
T20S T21S T22S T23S T24S T25S T31I T32O = 00-own_parts:NFET_SOT23: n-FET, generic SOT23
T30I T30O = 00-own_parts:PFET_GSFT06130: p-FET, GSFT06130, 60V, 140A, 4.6mR, D2PAK
U10 = 00-own_parts:STM32G474MCT6: MCU, STM32G474, ARM Cortex-M4 32-bit MCU+FPU,170 MHz / 213 DMIPS, 256 KB FLASH, 128 KB SRAM, rich analog, math acc, 184 ps 12 chan hi-res timer, LQFP80
U20 U21 U30 = 00-own_parts:TS1103-200: Current sense amplifier, bi-directional, 200x gain, SOT23-6, F#243-7987
U20B U21B U30B = 00-own_parts:AD8605ARTZ: OPAMP, 10 MHz, 5 V/µs, 2V7..5V5, SOT23-5, F#237-6717
U20P = 00-own_parts:UCC27211A-Q1: Driver, half bridge FET driver, 120V, 3A7/4A5, SO8-EP
Z20C Z20G Z21C Z21G Z22C Z22G Z23C Z23G Z24G Z25G Z30I Z30O = 00-own_parts:ZENER_SOD80: Zener, generic SOD80

## Net classes
1 dikke power: width 0.4 mm, clearance 0.5 mm